# Altium schematic sheet ATT.SchDoc: Attanuator
size A3; SheetNumber: 15; SheetTotal: 17
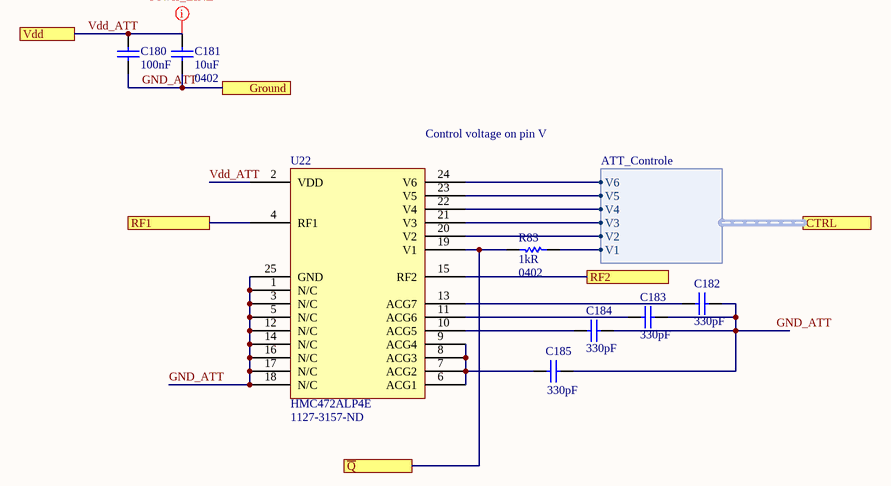
[diagram p0: ATT.SchDoc]

## Parts
C180  100nF  [CAP 0201/0603 KK]
C181  10uF  Case/Package: 0402  [CAP 0402/1005 RF KK]
C182  330pF  [CAP 0402/1005 RF KK]
C183  330pF  [CAP 0402/1005 RF KK]
C184  330pF  [CAP 0402/1005 RF KK]
C185  330pF  [CAP 0402/1005 RF KK]
R83  1kR  Case/Package: 0402  [RES 0402/1005 RF KK]
U22  HMC472ALP4E  Supplier Part Number 1: 1127-3157-ND  [HMC472ALP4E]

## Ports
CTRL (harness ATT_Controle), Ground, RF1, RF2, Vdd, ~{Q}

## Harnesses
ATT_Controle: V1, V2, V3, V4, V5, V6

## Nets
GND_ATT: C180.1 C181.1 C182.2 C183.2 C184.2 C185.2 U22.1(N/C) U22.3(N/C) U22.5(N/C) U22.12(N/C) U22.14(N/C) U22.16(N/C) U22.17(N/C) U22.18(N/C) U22.25(GND) ; port Ground
~{Q}: R83.1 U22.19(V1) ; port ~{Q}
RF1: U22.4(RF1) ; port RF1
RF2: U22.15(RF2) ; port RF2
Vdd_ATT: C180.2 C181.2 U22.2(VDD) ; port Vdd
NetC182_1: C182.1 U22.13(ACG7)
NetC183_1: C183.1 U22.11(ACG6)
NetC184_1: C184.1 U22.10(ACG5)
NetC185_1: C185.1 U22.6(ACG1) U22.7(ACG2) U22.8(ACG3) U22.9(ACG4)
NetR83_2: R83.2 ; port CTRL.V1
NetU22_20: U22.20(V2) ; port CTRL.V2
NetU22_21: U22.21(V3) ; port CTRL.V3
NetU22_22: U22.22(V4) ; port CTRL.V4
NetU22_23: U22.23(V5) ; port CTRL.V5
NetU22_24: U22.24(V6) ; port CTRL.V6

## Layout directives
net class Power_LINE: Vdd_ATT

## Notes on the sheet
- (near U22) Control voltage on pin V
- Title
- Size:
- Date:
- A3
- Number:
- Time:
- Revision:
- Sheet
- of
- File:

## Library data of the parts
C180 = Capacitor: Manufacturer 1: Murata; Manufacturer Part Number 1: GRM033R61C104ME84D; Voltage Rating: 16V; Tolerance: 20%; Dielectric: X5R; Supplier 1: Digi-Key; Supplier Part Number 1: 490-9986-1-ND; Stock 1: 550070; Pricing 1: 1=0.10000, 10=0.05400, 100=0.02430, 500=0.01732, 1000=0.01361, 2500=0.01238, 5000=0.01139 (USD); RoHS: Yes; Mount: Surface Mount; Case/Package: 0201; Weight: 1.2E-05oz; Case Code (Metric): 0603; Case Code (Imperial): 0201; Min Operating Temperature: -55°C; Max Operating Temperature: 85°C; Capacitance: 100nF; Packaging: Tape and Reel; Termination: SMD/SMT; Voltage Rating (DC): 16V; Package Quantity: 15000; Length: 0.024inch; Height: 0.3mm; Width: 0.3mm; Thickness: 0.013inch; ComponentLink1URL: http://www.mouser.com/ds/2/281/c02e-2905.pdf?src-supplier=Mouser; ComponentLink1Description: http://www.mouser.com/ds/2/281/c02e-2905.pdf?src-supplier=Mouser; ComponentLink2URL: http://search.murata.co.jp/Ceramy/image/img/A01X/G101/ENG/GRM033R61C104ME84-01.pdf?src-supplier=Digi-Key; ComponentLink2Description: http://search.murata.co.jp/Ceramy/image/img/A01X/G101/ENG/GRM033R61C104ME84-01.pdf?src-supplier=Digi-Key
C181 = Capacitor: CAP CER 10UF 6.3V X5R 0402; Manufacturer: Murata; Manufacturer Part Number: GRJ155R60J106ME11D; Tolerance: 20%; Supplier 1: Digi-Key; Supplier Part Number 1: 490-13211-1-ND; RoHS: Yes; Category: Ceramic Capacitors; Stock 1: 1136490; Pricing 1: 1=0,21000, 10=0,14500, 50=0,08680, 100=0,07330, 500=0,05016, 1000=0,04436, 2500=0,04244, 5000=0,03858 (USD); Mount: Surface Mount; Case Code (Metric): 1005; Case Code (Imperial): 0402; Min Operating Temperature: -55°C; Max Operating Temperature: 85°C; Packaging: Cut Tape; Capacitance: 10uF; Voltage Rating: 6.3V; Features: Soft Termination; Length: 0.039inch; Width: 0.02inch; Thickness: 0.028inch; ComponentLink1URL: http://psearch.en.murata.com/capacitor/product/GRJ155R60J106ME11%23.pdf?src-supplier=Digi-Key; ComponentLink1Description: http://psearch.en.murata.com/capacitor/product/GRJ155R60J106ME11%23.pdf?src-supplier=Digi-Key
C182-C185 = Capacitor: Manufacturer 1: Walsin Technologies; Manufacturer Part Number 1: 0402N331F500CT; Tolerance: 1%; Dielectric: C0G; Supplier 1: Digi-Key; Supplier Part Number 1: 1292-1307-1-ND; Stock 1: 23341; Pricing 1: 1=0.12000, 10=0.09000, 100=0.04030, 500=0.02876, 1000=0.02260, 2500=0.02054, 5000=0.01890 (USD); RoHS: Yes; Case/Package: 0402; Min Operating Temperature: -55°C; Max Operating Temperature: 125°C; Packaging: Tape and Reel; Capacitance: 330pF; Length: 1mm; Depth: 0.5mm; ComponentLink1URL: http://components.arrow.com/part/dataview/0323_06535843?src-supplier=Arrow+Europe; ComponentLink1Description: http://components.arrow.com/part/dataview/0323_06535843?src-supplier=Arrow+Europe; ComponentLink2URL: http://www.passivecomponent.com/indexsea/0402N331F500CT-IN.pdf?src-supplier=Digi-Key; ComponentLink2Description: http://www.passivecomponent.com/indexsea/0402N331F500CT-IN.pdf?src-supplier=Digi-Key
R83 = Resistor: Manufacturer 1: Yageo; Manufacturer Part Number 1: RC0402FR-071KL; Tolerance: 1%; Temperature Coefficient: 100ppm/°C; Power Rating: 62.5mW; Voltage Rating: 50V; Supplier 1: Digi-Key; Supplier Part Number 1: 311-1.00KLRCT-ND; Stock 1: 57541929; Pricing 1: 1=0,10000, 10=0,01600, 100=0,00640, 1000=0,00289, 2500=0,00251, 5000=0,00207 (USD); RoHS: Yes; Number of Pins: 2; Case Code (Imperial): 0402; Case Code (Metric): 1005; Min Operating Temperature: -55°C; Max Operating Temperature: 155°C; Packaging: Tape and Reel; Resistance: 1kR; Composition: Thick Film; Voltage Rating (DC): 50V; Termination: SMD/SMT; Military Standard: Not; Length: 1mm; Height: 0.32mm; Width: 0.5mm; Depth: 0.5mm; REACH SVHC: Unknown; Lead Free: Lead Free; ComponentLink1URL: https://datasheet.ciiva.com/11819/0900766b80c66297-11819477.pdf?src-supplier=RSComponents; ComponentLink1Description: https://datasheet.ciiva.com/11819/0900766b80c66297-11819477.pdf?src-supplier=RSComponents; ComponentLink2URL: https://datasheet.ciiva.com/12666/pyu-rc0402-51-rohs-l-6-r-12666741.pdf?src-supplier=Mouser; ComponentLink2Description: https://datasheet.ciiva.com/12666/pyu-rc0402-51-rohs-l-6-r-12666741.pdf?src-supplier=Mouser; ComponentLink3URL: https://datasheet.ciiva.com/17063/pyu-rc0402-51-rohs-l-6-r-17063193.pdf?src-supplier=Future+Electronics; ComponentLink3Description: https://datasheet.ciiva.com/17063/pyu-rc0402-51-rohs-l-6-r-17063193.pdf?src-supplier=Future+Electronics; ComponentLink4URL: https://datasheet.ciiva.com/22747/1018594-22747513.pdf?src-supplier=Element14; ComponentLink4Description: https://datasheet.ciiva.com/22747/1018594-22747513.pdf?src-supplier=Element14; ComponentLink5URL: https://datasheet.ciiva.com/7849/1018594-7849869.pdf?src-supplier=Element14; ComponentLink5Description: https://datasheet.ciiva.com/7849/1018594-7849869.pdf?src-supplier=Element14; ComponentLink6URL: https://datasheet.ciiva.com/7983/1018594-7983502.pdf?src-supplier=Element14; ComponentLink6Description: https://datasheet.ciiva.com/7983/1018594-7983502.pdf?src-supplier=Element14; ComponentLink7URL: https://datasheet.ciiva.com/7849/1018594-7849871.pdf?src-supplier=Element14; ComponentLink7Description: https://datasheet.ciiva.com/7849/1018594-7849871.pdf?src-supplier=Element14
U22 = HMC472ALP4E: ANALOG DEVICES   HMC472ALP4E   RF ATTENUATOR, 3.8GHZ, 5.5V, HQFN-24; Min Supply Voltage: 4.5V; Attenuation Value: 31.5dB; Impedance: 50R; Max Power Dissipation: 560mW; Number of Bits: 6; Number of Channels: 1; Insertion Loss: 3dB; Operating Supply Voltage: 5V; Supplier 1: Digi-Key; Manufacturer: Analog Devices; Manufacturer Part Number: HMC472ALP4E; Stock 1: 867; Pricing 1: 1 = 7,47000, 10 = 6,84400, 25 = 6,22160, 100 = 5,59940, 250 = 5,13284, 500 = 4,66620, 1000 = 4,19958 (USD); RoHS: Yes; Mount: Surface Mount; Case/Package: SMD/SMT; Number of Pins: 24; Contact Plating: Tin,Matte; Min Operating Temperature: -40°C; Max Operating Temperature: 85°C; Max Supply Voltage: 5.5V; Packaging: Cut Tape; Max Frequency: 3.8GHz; Package Quantity: 50; Min Input Voltage: 4.5V; Max Input Voltage: 5.5V; REACH SVHC: No SVHC; Lead Free: Contains Lead; ComponentLink1URL: http://www.mouser.com/ds/2/609/hmc472a-879296.pdf?src-supplier=Mouser; ComponentLink1Description: http://www.mouser.com/ds/2/609/hmc472a-879296.pdf?src-supplier=Mouser; ComponentLink2URL: http://www.analog.com/media/en/technical-documentation/data-sheets/hmc472a.pdf?src-supplier=Avnet+Asia; ComponentLink2Description: http://www.analog.com/media/en/technical-documentation/data-sheets/hmc472a.pdf?src-supplier=Avnet+Asia; ComponentLink3URL: http://www.farnell.com/datasheets/1868224.pdf?src-supplier=Element14; ComponentLink3Description: http://www.farnell.com/datasheets/1868224.pdf?src-supplier=Element14; ComponentLink4URL: https://www.hittite.com/content/documents/data_sheet/hmc472alp4.pdf?src-supplier=Avnet; ComponentLink4Description: https://www.hittite.com/content/documents/data_sheet/hmc472alp4.pdf?src-supplier=Avnet; ComponentLink5URL: https://www.analog.com/media/en/technical-documentation/data-sheets/hmc472a.pdf?src-supplier=Digi-Key; ComponentLink5Description: https://www.analog.com/media/en/technical-documentation/data-sheets/hmc472a.pdf?src-supplier=Digi-Key